# Altium project Custom_PFC.PrjPcb
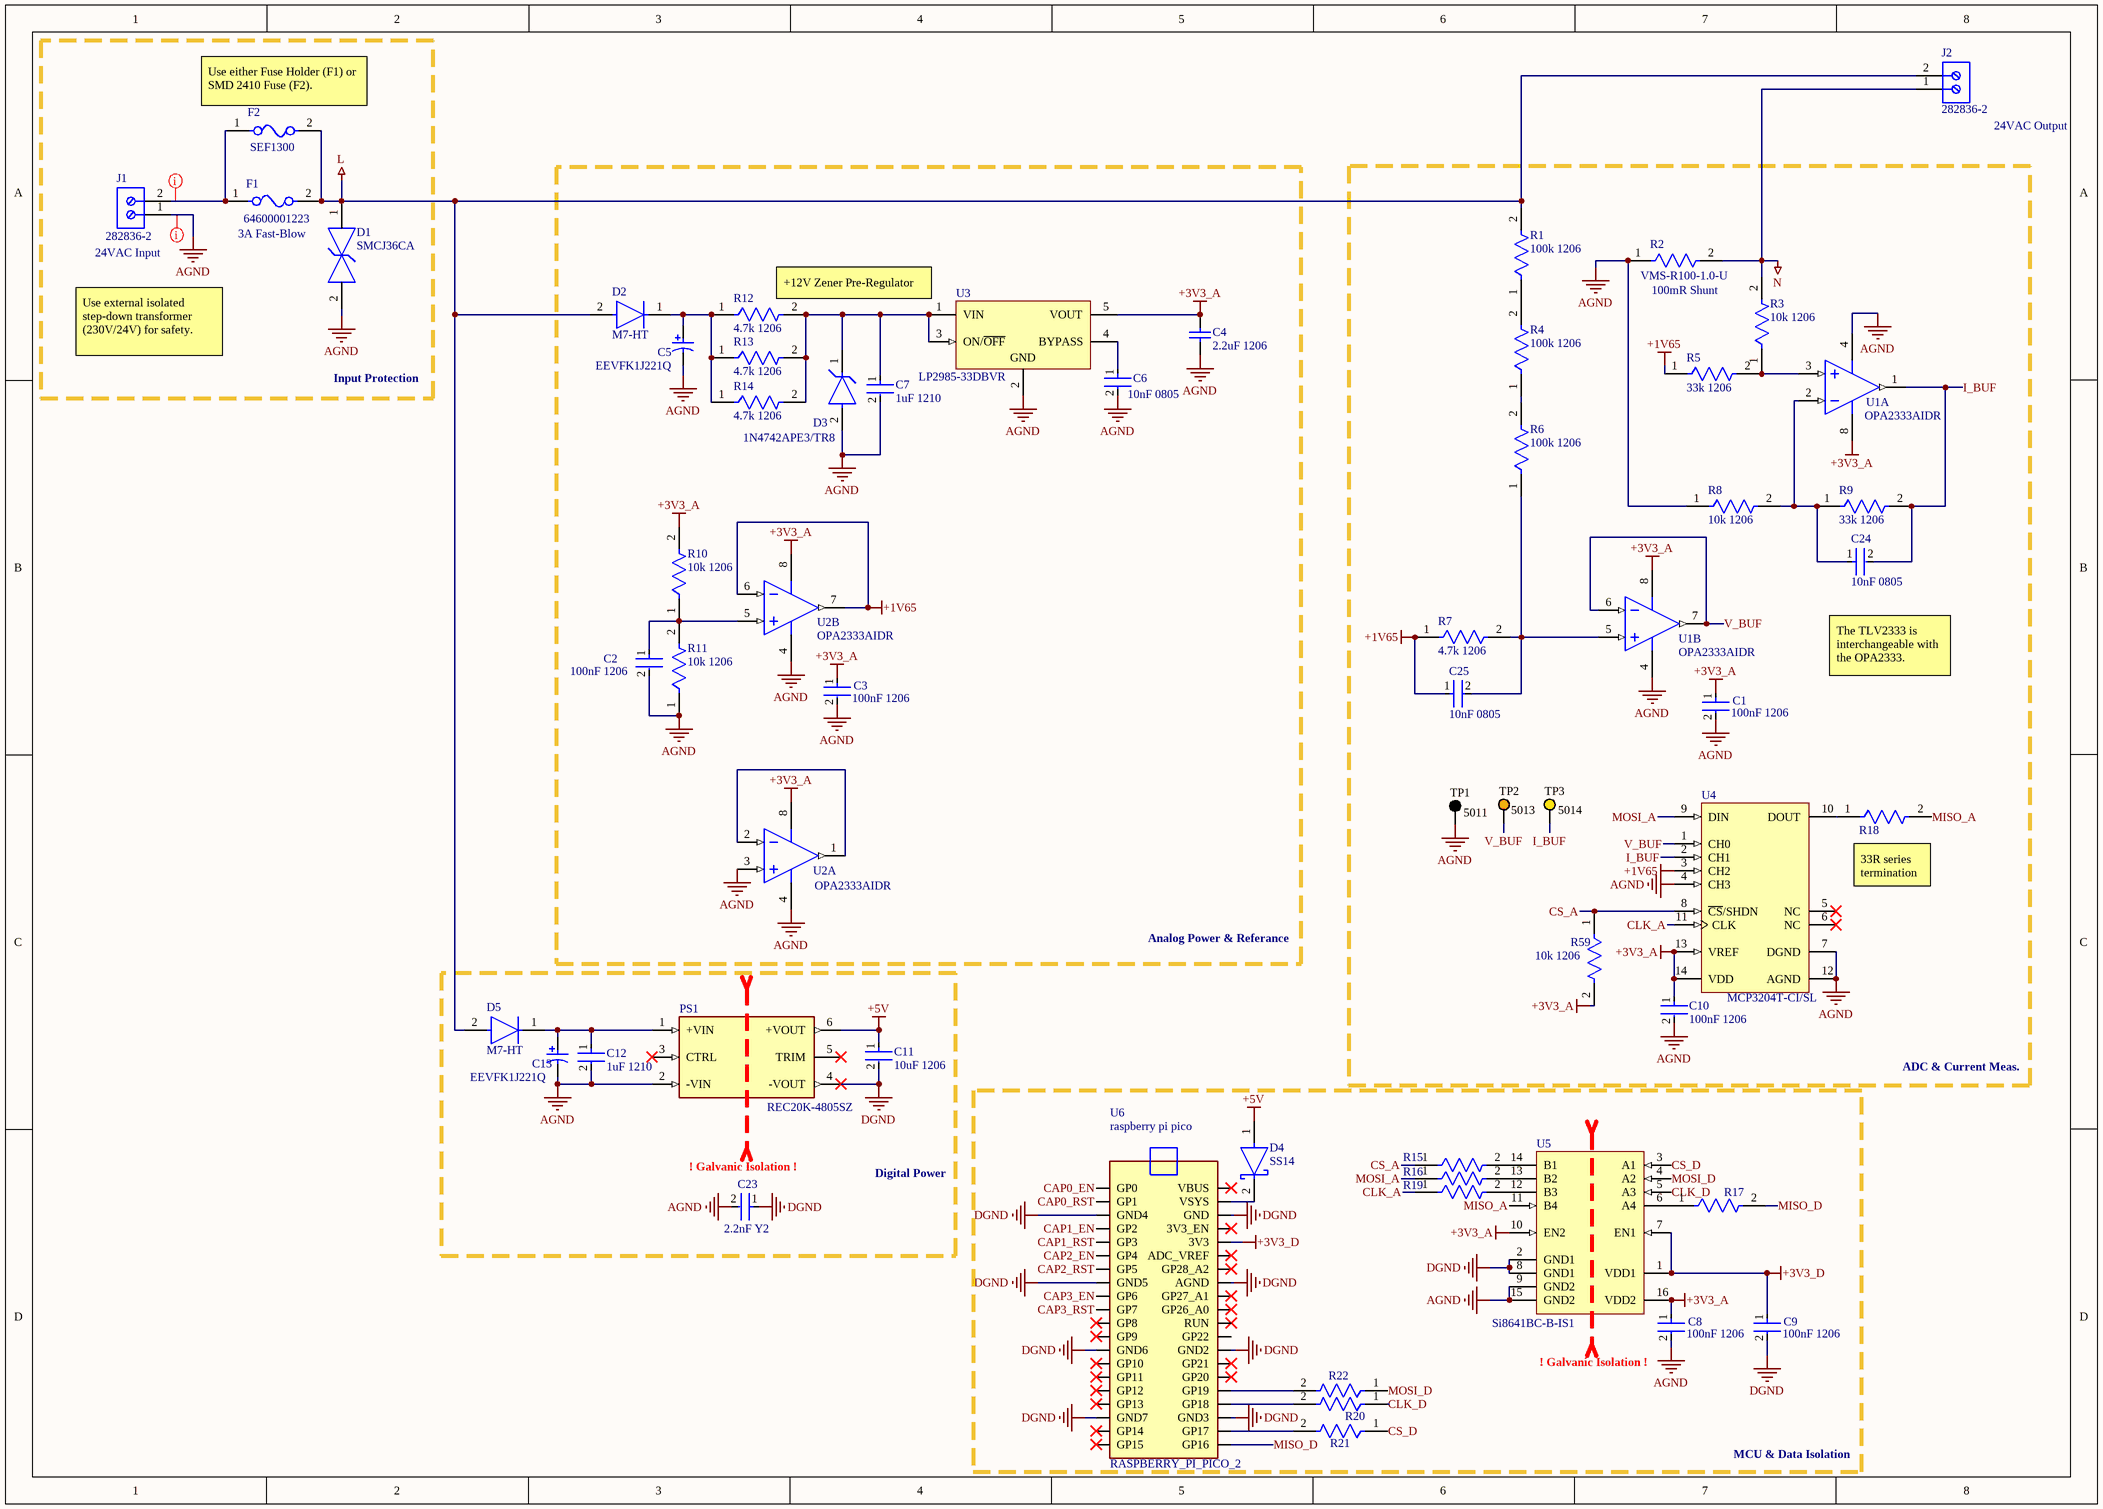
[diagram p0: Measurement_Control.SchDoc]
2 sheets, 127 parts. Net scope: global (net labels, ports and power ports of the same name join across sheets).
Board file: Main.PcbDoc
Sheets:
  Measurement_Control.SchDoc
  Capacitor_Bank.SchDoc

## Sheet Measurement_Control.SchDoc
size A3; DrawnBy: Ebubekir Tasci; SheetNumber: 1; SheetTotal: 2

### Parts
C1  100nF 1206  [FP-C1206X104J3GACTU-MFG]
C2  100nF 1206  [FP-C1206X104J3GACTU-MFG]
C3  100nF 1206  [FP-C1206X104J3GACTU-MFG]
C4  2.2uF 1206  [CAPC1206(3216)190_M]
C5  EEVFK1J221Q  [PNSC-FK-V-H13_V]
C6  10nF 0805  [FP-C0805C-DN-MFG]
C7  1uF 1210  [FP-CL32-IPC_C]
C8  100nF 1206  [FP-C1206X104J3GACTU-MFG]
C9  100nF 1206  [FP-C1206X104J3GACTU-MFG]
C10  100nF 1206  [FP-C1206X104J3GACTU-MFG]
C11  10uF 1206  [FP-C1206C-EH-MFG]
C12  1uF 1210  [FP-CL32-IPC_C]
C13  EEVFK1J221Q  [PNSC-FK-V-H13_V]
C23  2.2nF Y2  [FP-DE2_D8_T5_F5_d0_6-0_05-MFG]
C24  10nF 0805  [FP-C0805C-DN-MFG]
C25  10nF 0805  [FP-C0805C-DN-MFG]
D1  SMCJ36CA  [FP-SMCJ-MFG]
D2  M7-HT  [FP-SMA-MFG]
D3  1N4742APE3/TR8  [FP-1N4742APE3-TR8-MFG]
D4  SS14  [FP-403AE-MFG]
D5  M7-HT  [FP-SMA-MFG]
F1  64600001223  [FP-64600001223-MFG]
F2  SEF1300  [FP-0451-MFG]
J1  282836-2  [TECO-282836-2_V]
J2  282836-2  [TECO-282836-2_V]
PS1  REC20K-4805SZ  [CONV_REC20K-4805SZ]
R1  100k 1206  [FP-RQ732B-IPC_C]
R2  VMS-R100-1.0-U  [FP-CRA2512-IPC_C]
R3  10k 1206  [FP-RT1206-MFG]
R4  100k 1206  [FP-RQ732B-IPC_C]
R5  33k 1206  [FP-RT1206-MFG]
R6  100k 1206  [FP-RQ732B-IPC_C]
R7  4.7k 1206  [FP-AT1206-IPC_B]
R8  10k 1206  [FP-RT1206-MFG]
R9  33k 1206  [FP-RT1206-MFG]
R10  10k 1206  [FP-RT1206-MFG]
R11  10k 1206  [FP-RT1206-MFG]
R12  4.7k 1206  [FP-AT1206-IPC_B]
R13  4.7k 1206  [FP-AT1206-IPC_B]
R14  4.7k 1206  [FP-AT1206-IPC_B]
R15  33R 0805  [FP-RT0805-MFG]  (value not drawn)
R16  33R 0805  [FP-RT0805-MFG]  (value not drawn)
R17  33R 0805  [FP-RT0805-MFG]  (value not drawn)
R18  33R 0805  [FP-RT0805-MFG]  (value not drawn)
R19  33R 0805  [FP-RT0805-MFG]  (value not drawn)
R20  33R 0805  [FP-RT0805-MFG]  (value not drawn)
R21  33R 0805  [FP-RT0805-MFG]  (value not drawn)
R22  33R 0805  [FP-RT0805-MFG]  (value not drawn)
R59  10k 1206  [FP-RT1206-MFG]
TP1  5011  [KSTN-5011_V]
TP2  5013  [KSTN-5013_V]
TP3  5014  [KSTN-5014_V]
U1  OPA2333AIDR  [D0008A_N]  (parts A,B of 2)
U2  OPA2333AIDR  [D0008A_N]  (parts A,B of 2)
U3  LP2985-33DBVR  [DBV0005A_M]
U4  MCP3204T-CI/SL  [SOIC-SL14_N]
U5  Si8641BC-B-IS1  [SLAB-SOIC-16-NB_M]
U6  RASPBERRY_PI_PICO_2  [RASPBERRY_PI_PICO]

### Blocks framed on the sheet
Analog Power & Referance: C2-C7 D2 D3 R10-R14 U2 U3

### Nets
+1V65: C25.1 R5.1 R7.1 U2.6(IN_B-) U2.7(OUT_B) U4.3(CH2)
+3V3_A: C1.1 C3.1 C4.2 C8.1 C10.1 R10.2 R59.2 U1.8(V+) U2.8(V+) U3.5(VOUT) U4.13(VREF) U4.14(VDD) U5.10(EN2) U5.16(VDD2)
+3V3_D: C9.1 U5.1(VDD1) U5.7(EN1) U6.3V3
+5V: C11.1 D4.1(A) PS1.6(+VOUT)
AGND: C1.2 C2.2 C3.2 C4.1 C5.2 C6.2 C7.2 C8.2 C10.2 C12.2 C13.2 C23.2 D1.2 D3.2(A) J1.1 PS1.2(-VIN) R2.1 R8.1 R11.1 TP1.1 U1.4(V-) U2.3(IN_A+) U2.4(V-) U3.2(GND) U4.4(CH3) U4.7(DGND) U4.12(AGND) U5.9(GND2) U5.15(GND2)
DGND: C9.2 C11.2 C23.1 PS1.4(-VOUT) U5.2(GND1) U5.8(GND1) U6.AGND U6.GND U6.GND2 U6.GND3 U6.GND4 U6.GND5 U6.GND6 U6.GND7
L: D1.1 D2.2(A) D5.2(A) F1.2 F2.2 J2.2 R1.2
N: J2.1 R2.2 R3.2
CAP0_EN: U6.GP0
CAP0_RST: U6.GP1
CAP1_EN: U6.GP2
CAP1_RST: U6.GP3
CAP2_EN: U6.GP4
CAP2_RST: U6.GP5
CAP3_EN: U6.GP6
CAP3_RST: U6.GP7
CLK_A: R19.1 U4.11(CLK)
CLK_D: R20.1 U5.5(A3)
CS_A: R15.1 R59.1 U4.8(~{CS}/SHDN)
CS_D: R21.1 U5.3(A1)
I_BUF: C24.2 R9.2 TP3.1 U1.1(OUT_A) U4.2(CH1)
MISO_A: R18.2 U5.11(B4)
MISO_D: R17.2 U6.GP16
MOSI_A: R16.1 U4.9(DIN)
MOSI_D: R22.1 U5.4(A2)
V_BUF: TP2.1 U1.6(IN_B-) U1.7(OUT_B) U4.1(CH0)
NetC2_1: C2.1 R10.1 R11.2 U2.5(IN_B+)
NetC5_1: C5.1 D2.1(C) R12.1 R13.1 R14.1
NetC6_1: C6.1 U3.4(BYPASS)
NetC7_1: C7.1 D3.1(C) R12.2 R13.2 R14.2 U3.1(VIN) U3.3(ON/~{OFF})
NetC12_1: C12.1 C13.1 D5.1(C) PS1.1(+VIN)
NetC24_1: C24.1 R8.2 R9.1 U1.2(IN_A-)
NetC25_2: C25.2 R6.1 R7.2 U1.5(IN_B+)
NetD4_2: D4.2(C) U6.VSYS
NetF1_1: F1.1 F2.1 J1.2
NetR1_1: R1.1 R4.2
NetR3_1: R3.1 R5.2 U1.3(IN_A+)
NetR4_1: R4.1 R6.2
NetR15_2: R15.2 U5.14(B1)
NetR16_2: R16.2 U5.13(B2)
NetR17_1: R17.1 U5.6(A4)
NetR18_1: R18.1 U4.10(DOUT)
NetR19_2: R19.2 U5.12(B3)
NetR20_2: R20.2 U6.GP18
NetR21_2: R21.2 U6.GP17
NetR22_2: R22.2 U6.GP19
NetU2_1: U2.1(OUT_A) U2.2(IN_A-)

Not connected (* = marked no-connect by the designer): PS1 3(CTRL)* 5(TRIM)*; U4 5(NC)* 6(NC)*; U6 3V3_EN* ADC_VREF* GP8* GP9* GP10* GP11* GP12* GP13* GP14* GP15* GP20* GP21* GP22 GP26_A0* GP27_A1* GP28_A2* RUN* VBUS*

### Layout directives
rule Supply Nets [Voltage = 230.0]; rule Signal Stimulus [Kind - Single Pulse    Level - High    Start Time = 0.000    Stop Time = 10.00m    Period Time = 20.00m]: NetF1_1
rule Supply Nets [Voltage = 0.000]; rule Signal Stimulus [Kind - Single Pulse    Level - High    Start Time = 0.000    Stop Time = 10.00m    Period Time = 20.00m]: AGND

### Notes on the sheet
- (near F2) Use either Fuse Holder (F1) or SMD 2410 Fuse (F2).
- (near J2) 24VAC Output
- 3A Fast-Blow
- (near J1) 24VAC Input
- (near R12) +12V Zener Pre-Regulator
- (near R2) 100mR Shunt
- Use external isolated step-down transformer (230V/24V) for safety.
- Input Protection
- The TLV2333 is interchangeable with the OPA2333.
- 33R series termination
- ADC & Current Meas.
- (near C23) ! Galvanic Isolation !
- Digital Power
- (near C8) ! Galvanic Isolation !
- MCU & Data Isolation
- (in symbol CMP-007-000000-1) raspberry pi pico

### Library data of the parts
C1-C3 C8-C10 = CMP-03020-034648-1: CAP CER 0.1UF 25V C0G/NP0 1206 C1206X104J3GACTU; RoHS Compliant: Yes
C4 = CMP-1037-04830-1: CAP 2.2uF 50V ±5% 1206 (3216 Metric) Thickness 1.9mm SMD; Case-EIA: 1206; Tolerance: Â±5%; Case-Metric: 3216; Value: 2.2uF; Rated Voltage: 50 V; Max Thickness: 1.9 mm; Technology: SMT
C5 C13 = CMP-2000-06222-1: Aluminum Electrolytic Capacitor, 220 uF, +/- 20%, 63 V, 2-Pin SMD (Size Code H13), -55 to 105 degC, RoHS, Tape and Reel; Manufacturer: Panasonic; Impedance: 0.16ohm; Life Time @ Temperature: 2000hours@105°C; Product Range: PANASONIC-?????FK; Voltage Rating: 63V; External Length / Height: 13.5mm; Ripple Current Temperature: 105°C; Ripple Current Frequency: 100kHz; Ripple Current AC: 800mA; Power Factor: 0.08; Power Factor Frequency: 120Hz; AE Capacitor Case: RadialCan-SMD; Capacitance: 220µF; Operating Lifetime: 2000h; SVHC: NoSVHC(16-Dec-2013); Diameter: 12.5mm; Package Description: 2-Pin Electrolytic Aluminum Capacitor, Body 13.5 x 13.5 mm; Height: 13.5mm; Package URL: http://industrial.panasonic.com/cdbs/www-data/pdf/RDE0000/DME0000COL48.pdf; Lifetime @ Temperature: 2000hours@105°C; Series: FK; Mounting Technology: SurfaceMount; Datasheet Version: 03/2016; Package / Case: H13; Voltage Rating V DC: 63V; Capacitance Tolerance ±: ±20%; Tolerance +: 20%; Capacitance Tolerance: ±20%; Package Reference: FK-V-H13; Datasheet URL: https://industrial.panasonic.com/cdbs/www-data/pdf/RDE0000/ABA0000C1181.pdf; Operating Temperature Range: -55°Cto+105°C; Manufacturer URL: http://www.panasonic.com/; Operating Temperature Min: -55°C; Capacitor Terminals: SMD; Packaging: CutTape; Operating Temperature Max: 105°C; Tolerance -: 20%; Operating life Time: 2000h; Capacitor Case Style: SMD
C6 C24 C25 = CMP-1036-03849-3: CAP CER 10000PF 100V NP0 0805 C0805C103F1GACTU; Manufacturer: KEMET; Temperature Coefficient: 30ppm/°C; Value: 10,000 pF; Material: Ceramic; Temperature Characteristic: C0G; Tolerance: 0.01; Temperature: -55°C to +125°C; Ipc Land Pattern Name: CAPC200125X78; Octopart: https://octopart.com/c0805c103f1gactu-kemet-18614614; Package: C0805C-DN; Mouser Description: Cap Ceramic 0.01uF 100V C0G 1% Pad SMD 0805 125C T/R; Height: 0.88mm; Category: Cap; ComponentLink2Description: Datasheet; Device Class L2: Capacitors; Lead Free: Yes; Temperature Range Low: -55°C; RoHS: TRUE; Device Class L1: Passive Components; Temperature Range High: +125°C; Automotive: No; Digikey Description: CAP CER 10000PF 100V NP0 0805; Voltage Rating: 100 V; Device Class L3: Ceramic Capacitors; ComponentLink2URL: https://content.kemet.com/datasheets/KEM_C1003_C0G_SMD.pdf; Capacitance: 10,000 pF; Manufacturer Part Number: C0805C103F1GACTU
C7 C12 = CMP-13271-002987-1: Cap Ceramic 1uF 50V X7R ±10% SMD 1210 +125°C Embossed T/R CL32B105KBHNNNE; Voltage: 50V; Package Quantity: 1; Radiation Hardening: No; Case Code (Metric): 3225; Packaging: Tape and Reel; Min Operating Temperature: -55°C; Width: 0.098inch; Dielectric: X7R; Case/Package: 1210; Material: Ceramic; Tolerance: 10%; Max Operating Temperature: 125°C; Voltage Rating: 50V; Mount: Surface Mount; Capacitance: 1uF; Case Code (Imperial): 1210; Depth: 2.5mm; Height: 1.6mm; Thickness: 0.071inch; Length: 3.2mm
C11 = CMP-03020-004605-1: CAP CER 10UF 25V X7R 1206 C1206C106K3RACAUTO; Manufacturer: KEMET; Material: Ceramic; Automotive Grade: Grade 1; Temperature Coefficient: 15%; Tolerance: 10%; Manufacturer Part Number: C1206C106K3RACAUTO; Digikey Description: CAP CER 10UF 25V X7R 1206; Lead Free: Yes; Temperature Characteristic: X7R; Temperature: -55°C to +125°C; Temperature Range Low: -55°C; Octopart: https://octopart.com/c1206c106k3racauto-kemet-65707106; Temperature Range High: +125°C; RoHS: TRUE; Package: C1206C-EH; Device Class L1: Passive Components; Device Class L3: Ceramic Capacitors; Automotive: Yes; Value: 10uF; Category: Cap; ComponentLink2Description: Datasheet; Capacitance: 10uF; Height: 1.8mm; ComponentLink2URL: https://content.kemet.com/datasheets/KEM_C1023_X7R_AUTO_SMD.pdf; Voltage Rating: 25V; Device Class L2: Capacitors; Ipc Land Pattern Name: CAPC320160X160
C23 = CMP-06035-063093-1: CAP CER 2200PF 250VAC RADIAL DE2E3KY222MN2AM01F; Lead/Base Style: Formed Leads; Tolerance: 20%; Ratings: X1; Height - Seated (Max): 0.433inch; Package Quantity: 1000; Max Operating Temperature: 125°C; Capacitance: 2.2nF; Packaging: Tape and Reel; Min Operating Temperature: -40°C; Lead Pitch: 0.197inch; Series: KY; Lead Free: Lead Free; RoHS Compliant: Yes; Case/Package: Radial; Mount: Through Hole
D1 = CMP-08607-000079-1: TVS DIODE 36V 58.1V DO214AB; Manufacturer: Littelfuse Inc; Peak Pulse Current: 25.9A; Number Of Channels: 1; Peak Pulse Power: 1500W; Direction: Bidirectional; Breakdown Voltage: 40V; Max Junction Temp: +150°C; Mouser Description: SMCJ Series 58.1 V 1.5 kW Surface Mount Bi-Directional TVS Diode - DO-214AB; Temperature Range Low: -65°C; Package: SMCJ; Device Class L3: unset; Temperature Range High: +150°C; Automotive: No; Octopart: https://octopart.com/smcj36ca-littelfuse-351690; Device Class L2: TVS Diodes; ComponentLink2URL: https://www.littelfuse.com/~/media/electronics/datasheets/tvs_diodes/littelfuse_tvs_diode_smcj_datasheet.pdf.pdf; Category: Diode; RoHS: TRUE; Device Class L1: Circuit Protection; Reverse Standoff Voltage: 36V; Clamping Voltage: 58.1V; Manufacturer Part Number: SMCJ36CA; ComponentLink2Description: Datasheet; Height: 2.62mm; Lead Free: Yes; Temperature: -65°C to +150°C; Digikey Description: TVS DIODE 36V 58.1V DO214AB
D2 D5 = CMP-02540-000086-1: DIODE GEN PURP 1KV 1A DO214AC; Forward Voltage: 1.1V; Reverse Recovery Time: 1.8us; Peak Non-Repetitive Surge Current: 30A; Max Operating Temperature: 150°C; RoHS Compliant: Yes; Series: -; Number of Pins: 2; Packaging: Tape and Reel; Case/Package: SMA; Max Reverse Voltage (DC): 1kV; Min Operating Temperature: -55°C; Average Rectified Current: 1A; Mount: Surface Mount
D3 = CMP-06360-000055-1: DIODE ZENER 12V 1W DO204AL
D4 = CMP-2000-04943-2: DIODE SCHOTTKY 40V 1A SMA; Manufacturer: ON Semiconductor; Peak Reverse Current: 0.2mA; Max Junction Temp: +125°C; Standoff Height: 0.05mm; Max Surge Forward Current: 40A; Mouser Description: Schottky Diodes & Rectifiers SMA 40V 1.0A; RoHS: TRUE; Lead Free: Yes; Manufacturer Part Number: SS14; Device Class L3: Schottky Diodes; Category: Diode; Automotive: No; Digikey Description: DIODE SCHOTTKY 40V 1A SMA; ComponentLink2Description: Datasheet; Device Class L2: Diodes; Height: 2.5mm; Temperature Range High: +125°C; ComponentLink2URL: https://www.onsemi.com/pub/Collateral/SS19-D.PDF; Device Class L1: Discrete Semiconductors; Package: 403AE; Octopart: https://octopart.com/ss14-on+semiconductor-29205033; Max Repetitive Reverse Voltage: 40V; Temperature Range Low: -65°C; Forward Current: 1A; Temperature: -65°C to +125°C
F1 = CMP-08604-000020-1: FUSE BLOCK CART 250V 6.3A PCB; Manufacturer: Littelfuse Inc; Number Of Fuses: 1; Conn Orientation: Horizontal; ComponentLink2URL: https://www.littelfuse.com/~/media/electronics/datasheets/fuse_blocks/littelfuse_fuse_block_646_datasheet.pdf.pdf; Manufacturer Part Number: 64600001223; Mouser Description: Fuse Holder Screw Mount Bulk; Voltage Rating Ac: 250V; Voltage Rating Dc: 250V; Category: Fuse; Fuse Current: 6.3A; Octopart: https://octopart.com/64600001223-littelfuse-39645661; Package: 0; Automotive: No; Height: 12mm; Device Class L3: unset; ComponentLink2Description: Datasheet; Digikey Description: FUSE BLOCK CART 250V 6.3A PCB; Device Class L1: Circuit Protection; Lead Free: Yes; Device Class L2: Fuse Holders; RoHS: TRUE
F2 = CMP-08605-000063-1: FUSE 3A 250V 6125 FAST SMD; Fuse Interrupt Ac Current: 50A; Fuse I2T: 1.65A2Sec; RoHS: TRUE; Voltage Rating: 250V; Automotive: No; Mouser Description: Surface Mount Fuses 250V 3A; Package: 0451; Device Class L2: Fuses; Fuse Current: 3A; ComponentLink2Description: Datasheet; Lead Free: Yes; Temperature Range Low: -55°C; Max Fuse Ac Voltage: 250V; Temperature: -55°C to +125°C; Device Class L1: Circuit Protection; Category: Fuse; Height: 2.94mm; Temperature Range High: +125°C; ComponentLink2URL: https://www.littelfuse.com/~/media/electronics/datasheets/fuses/littelfuse_fuse_451_453_datasheet.pdf.pdf; Fuse Blow Speed: Fast; Device Class L3: unset; Fuse Interrupt Dc Current: 50A
J1 J2 = CMP-1684-00017-1: Female Header, Pitch 5 mm, 1 x 2 Position, Height 10 mm, Tail Length 3.5 mm, Rohs, Bulk; Manufacturer: TE Connectivity; Wire Gauge: 16-30AWG; Product Training Modules: Wire-to-BoardEurostyleTerminalBlocks; Clamp Material - Plating: Brass-NickelPlated; Voltage: 300V; Mating Orientation: HorizontalwithBoard; Current: 13.5A; Pitch: 0.197"(5.00mm); Screw Thread: M3; 3D Model: 282836-2.pdf; Other Names: 5ULV-02B / A98076; Dynamic Catalog: BuchananSeries; Number of Levels: 1; Torque - Screw: 0.68Nm(6Lb-In); Featured Product: EurostyleTerminalBlockConnectors; Positions Per Level: 2; Wire Termination: Screw-RisingCageClamp; Datasheet URL: http://www.te.com.cn/commerce/DocumentDelivery/DDEController?Action=showdoc&DocId=Catalog+Section%7F1308389_EUROSTYLE_TERMINAL_BLOCKS%7F0607%7Fpdf%7FEnglish%7FENG_CS_1308389_EUROSTYLE_TERMINAL_BLOCKS_0607.pdf%7F282836-2; Color: Green; Family: TerminalBlocks-WiretoBoard; RoHS Information: 282836-2StatementofCompliance; Standard Package: 300; Contact Material - Plating: Brass-TinPlated; Manufacturer URL: http://www.te.com; Housing Material: Polyamide(PA66),Nylon6/6; Features: Interlocking(Side); Package Description: Female Header, Pitch 5 mm, 1 x 2 Position, Height 10 mm, Tail Length 3.5 mm; Mounting Type: ThroughHole; Package Reference: THD; Packaging: Bulk; Series: Buchanan; Category: Connectors,Interconnects; Screw Material - Plating: Brass-NickelPlated
PS1 = CMP-068-000000-1: MF: Recom Power; Availability: Unavailable; Package: None; Source: REC20K-4805SZ.SchLib; Pin Count: 6; Price: None; Component Type: Standard; Design Item ID: REC20K-4805SZ; Value: *; MP: REC20K-4805SZ
R1 R4 R6 = CMP-03211-010469-1: RQ732B 1206 100KΩ 0.4W 10ppm/°C 0.1% 200V RQ73C2B100KBTDF; Manufacturer: TE; Automotive Grade: Grade 0; Package: RQ732B; Device Class L2: Resistors; Device Class L1: Passive Components; Tolerance: 0.1%; Value: 100KΩ; Automotive: Yes; Lead Free: Yes; ComponentLink2Description: Datasheet; Temperature Range Low: -55°C; Manufacturer Part Number: RQ73C2B100KBTDF; Temperature Range High: +155°C; Temperature: -55°C to +155°C; Composition: Thin Film; Temperature Coefficient: 10ppm/°C; Ipc Land Pattern Name: RESC310160X60; Voltage Rating: 200V; Power Rating: 0.4W; Octopart: https://octopart.com/rq73c2b100kbtdf-te+connectivity-99292337; Device Class L3: Chip SMD Resistors; Resistance: 100KΩ; RoHS: TRUE; Category: Res; Height: 0.75mm; ComponentLink2URL: https://www.te.com/commerce/DocumentDelivery/DDEController?Action=showdoc&DocId=Data+Sheet%7F1773270-2%7FA%7Fpdf%7FEnglish%7FENG_DS_1773270-2_A.pdf%7F9-2176388-1377; Series: RQ73
R2 = CMP-07231-006698-1: RES.SHUNT (6432) 2512 100m Ohms ±1% 3W AEC-Q200 SMT
R3 R8 R10 R11 R59 = CMP-03412-030854-1: RES SMD 10K OHM 0.1% 1/4W 1206 RT1206BRB0710KL; Manufacturer: Yageo; Temperature Coefficient: 10 ppm/°C; Power Rating: 0.25W; Voltage Rating: 200V; Value: 10KΩ; Tolerance: 0.005; Device Class L1: Passive Components; RoHS: TRUE; Ipc Land Pattern Name: RESC310160X55; Series: RT; Composition: Thin Film; Category: Res; Height: 0.65mm; Temperature Range Low: -55°C; Manufacturer Part Number: RT1206BRB0710KL; ComponentLink2URL: http://www.yageo.com/documents/recent/PYu-RT_1-to-0.01_RoHS_L_9.pdf; Footprint Url: http://www.yageo.com/exep/pages/download/literatures/PYu-R_Mount_10.pdf; Automotive: No; Digikey Description: RES SMD 10K OHM 0.1% 1/4W 1206; Lead Free: Yes; Temperature Range High: +155°C; Device Class L2: Resistors; Mouser Description: Thin Film Resistors 1/4W 10K ohm .1% 10ppm; Package: RT1206; Temperature: -55°C to +155°C; ComponentLink2Description: Datasheet; Octopart: https://octopart.com/rt1206brb0710kl-yageo-71402166; Device Class L3: Chip SMD Resistors; Resistance: 10KΩ
R5 R9 = CMP-03412-033789-1: RES SMD 33K OHM 0.25% 1/4W 1206 RT1206CRB0733KL; Manufacturer: Yageo; Value: 33KΩ; Tolerance: 0.01; Voltage Rating: 200V; Temperature Coefficient: 10 ppm/°C; Power Rating: 0.25W; Manufacturer Part Number: RT1206CRB0733KL; Lead Free: Yes; ComponentLink2URL: http://www.yageo.com/documents/recent/PYu-RT_1-to-0.01_RoHS_L_9.pdf; Category: Res; Temperature Range Low: -55°C; RoHS: TRUE; Height: 0.65mm; Device Class L1: Passive Components; Resistance: 33KΩ; Device Class L3: Chip SMD Resistors; Ipc Land Pattern Name: RESC310160X55; Footprint Url: http://www.yageo.com/exep/pages/download/literatures/PYu-R_Mount_10.pdf; Package: RT1206; Octopart: https://octopart.com/rt1206crb0733kl-yageo-71403169; ComponentLink2Description: Datasheet; Temperature Range High: +155°C; Device Class L2: Resistors; Digikey Description: RES SMD 33K OHM 0.25% 1/4W 1206; Series: RT; Composition: Thin Film; Automotive: No; Temperature: -55°C to +155°C
R7 R12-R14 = CMP-03412-045148-1: Thin Film Chip Resistors Automotive Grade 4.7kΩ 0.1% 25ppm/°C 1206 AT1206BRD074K7L
R15-R22 = CMP-03412-000516-1: RES SMD 33 OHM 0.1% 1/8W 0805; Manufacturer Part Number: RT0805BRD0733RL; Manufacturer: Yageo; Tolerance: 0.0025; Value: 33Ω; Power Rating: 0.125W; Voltage Rating: 150V; Temperature Coefficient: 25 ppm/°C; Height: 0.6mm; Automotive: No; Temperature: -55°C to +155°C; Digikey Description: RES SMD 33 OHM 0.1% 1/8W 0805; Temperature Range High: +155°C; RoHS: TRUE; Footprint Url: http://www.yageo.com/exep/pages/download/literatures/PYu-R_Mount_10.pdf; Resistance: 33Ω; Device Class L1: Passive Components; Series: RT; Composition: Thin Film; Ipc Land Pattern Name: RESC200125X50; Category: Res; ComponentLink2Description: Datasheet; Device Class L2: Resistors; Mouser Description: Res Thin Film 0805 33 Ohm 0.1% 1/8W ±25ppm/°C Molded SMD SMD Paper T/R; Device Class L3: Chip SMD Resistors; ComponentLink2URL: http://www.yageo.com/documents/recent/PYu-RT_1-to-0.01_RoHS_L_9.pdf; Package: RT0805; Lead Free: Yes; Octopart: https://octopart.com/rt0805brd0733rl-yageo-1409436; Temperature Range Low: -55°C
TP1 = CMP-1672-00003-4: Test Point, Black, Through Hole, RoHS, Bulk; Manufacturer: Keystone; ComponentLink2URL: http://www.keyelco.com/product-pdf.cfm?p=1320; Colour: Black; Pins: 1; REACH SVHC: No SVHC; ComponentLink1URL: http://www.keyelco.com/; PackageReference: 5011; Contact Plating: Silver; Package Quantity: 100; Packaging: Bulk; RoHSCompliant: true; Height: 8.12 mm; PackageDescription: 1-Pin Through Hole Device, Dia 3.17 mm; Mount: Through Hole; Mounting Technology: Through Hole; DatasheetVersion: Rev. F, 12/2013; ComponentLink1Description: Manufacturer URL; Contact Material: Bronze; ComponentLink2Description: Datasheet
TP2 = CMP-1672-00005-4: Test Point, Orange, Through Hole, RoHS, Bulk; Manufacturer: Keystone; REACH SVHC: No SVHC; ComponentLink2Description: Datasheet; PackageDescription: 1-Pin Through Hole Device, Dia 3.17 mm; Package Quantity: 100; PackageReference: 5013; Contact Material: Bronze; DatasheetVersion: Rev. F, 12/2013; ComponentLink2URL: http://www.keyelco.com/product-pdf.cfm?p=1322; Contact Plating: Silver; ComponentLink1URL: http://www.keyelco.com/; Packaging: Bulk; ComponentLink1Description: Manufacturer URL; Colour: Orange; Height: 8.12 mm; RoHSCompliant: True; Mount: Through Hole; Mounting Technology: Through Hole
TP3 = CMP-1672-00006-4: Test Point, Yellow, Through Hole, RoHS, Bulk; Manufacturer: Keystone; PackageDescription: 1-Pin Through Hole Device, Dia 3.17 mm; REACH SVHC: No SVHC; ComponentLink2Description: Datasheet; ComponentLink2URL: http://www.keyelco.com/product-pdf.cfm?p=1323; Package Quantity: 100; Colour: Yellow; Height: 8.12 mm; RoHSCompliant: true; Contact Material: Bronze; Mount: Through Hole; Contact Plating: Silver; ComponentLink1URL: http://www.keyelco.com/; Packaging: Bulk; Mounting Technology: Through Hole; PackageReference: 5014; ComponentLink1Description: Manufacturer URL; DatasheetVersion: Rev. F, 12/2013
U1 U2 = CMP-0272-00762-3: 17 uA, MicroPower, Precision, Zero Drift CMOS Operational Amplifier, 1.8 to 5.5 V, -40 to 125 degC, 8-pin SOIC (D8), Green (RoHS & no Sb/Br); Manufacturer: Texas Instruments; Iq per channel(Max)(mA): 0.025; IIB(Max)(pA): 200; Total Supply Voltage(Min)(+5V is 5, +/-5V is 10): 1.8; Sub Family: Low Offset Voltage Amplifier (<=500uV), Low Power Amp (<=500uA), Low Supply Voltage Amplifier (<=2.7V), Precision Amplifier, Zero Drift Precision Amplifier; Vio (25C)(Max)(mV): 0.01; Offset Drift(Typ)(uV/C): 0.02; Slew Rate(Typ)(V/us): 0.16; Total Supply Voltage(Max)(+5V is 5, +/-5V is 10): 5.5; Number of Channels: 2; CMRR(Min)(dB): 106; ComponentLink1URL: http://www.ti.com/; ComponentLink3URL: http://www.ti.com/litv/pdf/msoi002j; PackageDescription: 8-Pin Plastic Small Outline, Body 4.9 x 3.9 mm, Pitch 1.27 mm; PartNumber: OPA2333AIDR; PackageReference: D0008A; Code_JEDEC: MS-012; Eco-Plan: Green (RoHS & no Sb/Br); ComponentLink2URL: http://www.ti.com/general/docs/lit/getliterature.tsp?genericPartNumber=OPA2333&fileType=pdf; ComponentLink2Description: Datasheet; PackageVersion: 4040047-3/M, 06/2011; ComponentLink1Description: Manufacturer URL; Mounting Technology: Surface Mount; DatasheetVersion: SBOS351C; ComponentLink3Description: Package Specification
U3 = CMP-0758-00080-2: Single Output Low Noise LDO, 150 mA, Fixed 3.3 V Output, 1.5% Tolerance, 2.2 to 16 V Input, Low IQ, 5-Pin SOT-23 (DBV), -40 to 125 degC, Green (RoHS & no Sb/Br), Tape and Reel; Manufacturer: Texas Instruments; Vdo (Typ) (mV): 280; Accuracy (%): 1.5; Output Options: Fixed Output; Fixed Output Options (V): 3.3; Iout (Max) (A): 0.15; Iq (Typ) (mA): 0.85; ComponentLink3Description: Package Specification; Packing: Tape and Reel; ComponentLink3URL: http://www.ti.com/litv/pdf/mpds018j; Vin (V): 2.2 to 16; Mounting Technology: Surface Mount; ComponentLink1URL: http://www.ti.com/; PartNumber: LP2985-33DBVR; PackageReference: DBV0005A; ComponentLink2URL: http://www.ti.com/lit/ds/symlink/lp2985-50.pdf; RoHS: TRUE; ComponentLink2Description: Datasheet; PackageVersion: 4073253-4/L; Operating Temperature Range (degC): -40 to 125; DatasheetVersion: SLVS522N; ComponentLink1Description: Manufacturer URL; PackageDescription: 5-Pin Plastic Small Outline, Body 2.9 x 1.6 mm, Pitch 0.95 mm
U4 = CMP-0188-00363-2: 2.7V 4-Channel/8-Channel 12-Bit A/D Converters with SPI Serial Interface, 14-Pin SOIC 150mil, C Performance Grade, Industrial Temperature, Tape and Reel; ComponentLink2Description: Datasheet; Code_IPC: SOIC127P600-14; DatasheetVersion: revE, Sep-2008; PackageReference: SOIC-SL14; ComponentLink3URL: http://www.microchip.com/stellent/groups/techpub_sg/documents/packagingspec/en012702.pdf; ComponentLink2URL: http://ww1.microchip.com/downloads/en/DeviceDoc/21298e.pdf; RevisionNote: URLs added.; PackageVersion: revBB, Aug-2009; ComponentLink3Description: Package Specification; ComponentLink1URL: http://www.microchip.com/; Code_JEDEC: MS-012-AB; ComponentLink1Description: Manufacturer URL; PackageDescription: 14-Lead Plastic Small Outline (SL) - Narrow, 3.90mm Body [SOIC]
U5 = CMP-0512-00190-1: Low-Power Quad-Channel Digital Isolator, 150 Mbps, 3.75 kVRMS Isolation Rating, -40 to 125 degC, 16-pin SOIC; Manufacturer: Silicon Labs; Maximum Data Rate (Mbps): 150; Maximum Propagation Delay (ns): 13; Sub-Family: Isolators; Enable Control: TRUE; Isolation Rating (kV): 3.75; Channel Type: Unidirectional; 10kV surge: FALSE; Code_IPC: J-STD-020; ComponentLink1URL: http://www.silabs.com/; ComponentLink1Description: Manufacturer URL; DatasheetVersion: Rev. 1.5; Code_JEDEC: MS-012; ComponentLink2Description: Datasheet; PackageDescription: 16-Pin Small-Outline Integrated Circuit, Body 9.9 x 3.9 mm, Pitch 1.27 mm; ComponentLink3URL: http://www.silabs.com/Support%20Documents/TechnicalDocs/si2401.pdf; ComponentLink2URL: http://www.silabs.com/Support%20Documents/TechnicalDocs/Si864x.pdf; PackageReference: SOIC-16-NB; PartNumber: Si8641BC-B-IS1; ComponentLink3Description: Package Specification; Mounting Technology: Surface Mount; AEC-Q100: FALSE
U6 = CMP-007-000000-1: Raspberry Pi Board, Arm Cortex-M0+; Core Architecture:Arm; Core Sub-Architecture:Cortex-M0+; Kit Contents:Raspberry Pi Pico Board; No. Of Bits:32Bit; Silicon Core Number:Rp2040; Silicon Manufacturer:Raspberry Pi; Package: None; Component Type: Standard; Value: *; MF: Raspberry Pi; Pin Count: 40; Check_prices: https://www.snapeda.com/parts/RASPBERRY%20PI%20PICO/Raspberry+Pi/view-part/?ref=eda; Source: RASPBERRY_PI_PICO.SchLib; Design Item ID: RASPBERRY_PI_PICO; SnapEDA_Link: https://www.snapeda.com/parts/RASPBERRY%20PI%20PICO/Raspberry+Pi/view-part/?ref=snap; MP: RASPBERRY PI PICO

## Sheet Capacitor_Bank.SchDoc
size A3; SheetNumber: 2; SheetTotal: 2
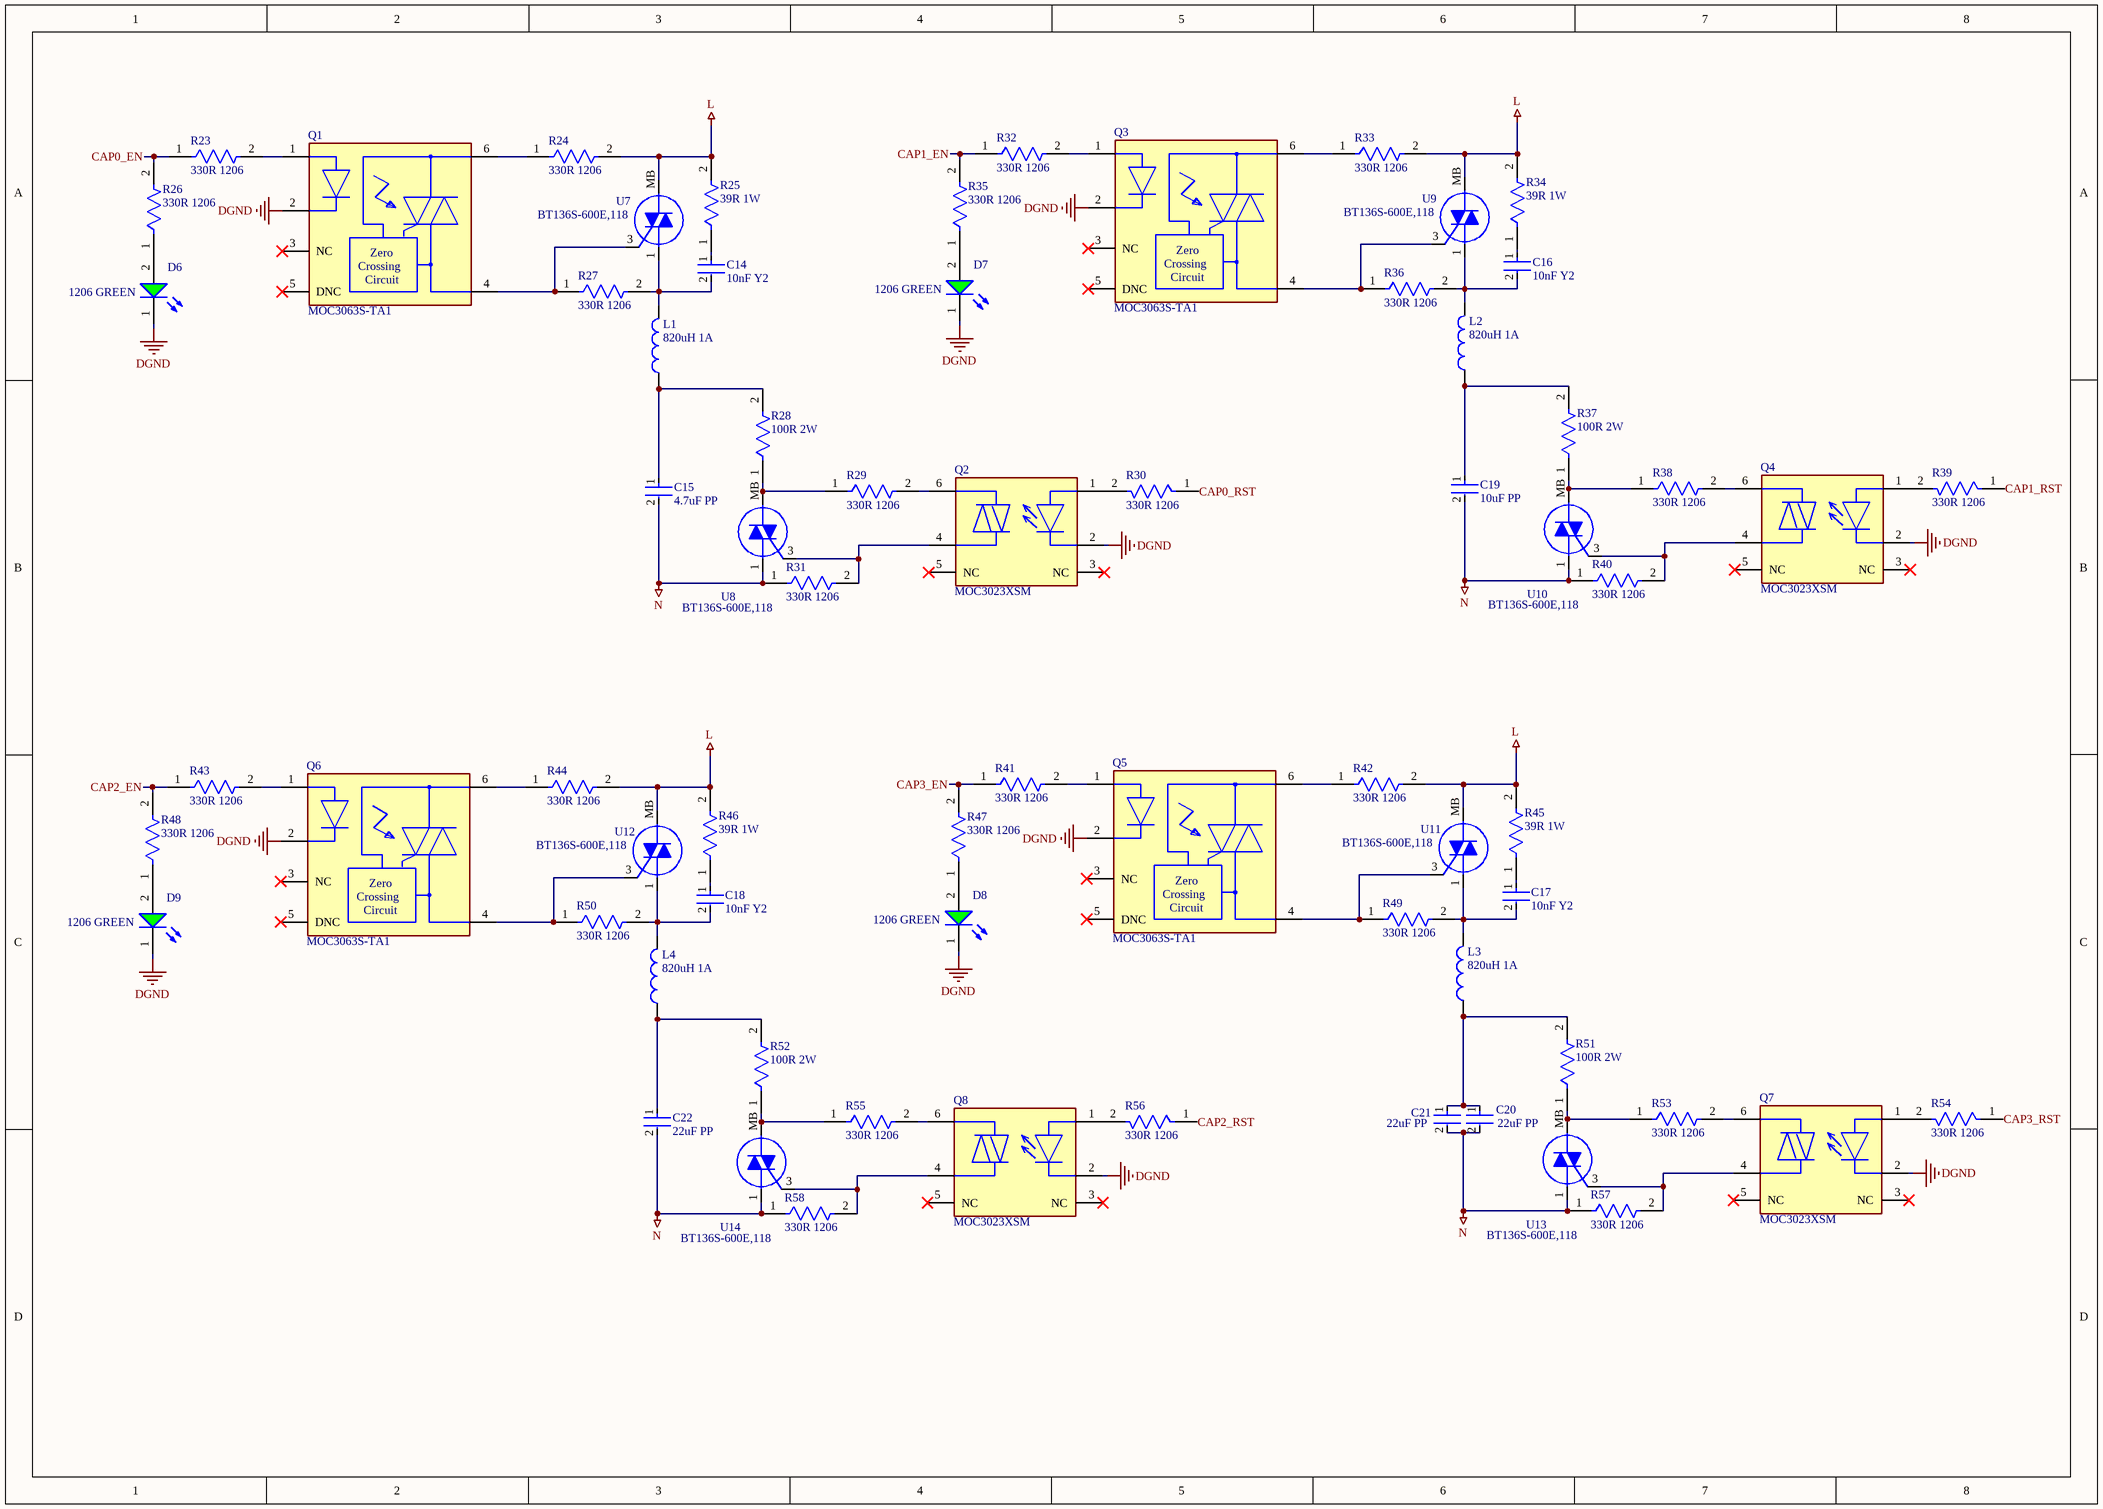
[diagram p1: Capacitor_Bank.SchDoc]

### Parts
C14  10nF Y2  [FP-R46KF310040P1M-MFG]
C15  4.7uF PP  [FP-C4BUY-MFG]
C16  10nF Y2  [FP-R46KF310040P1M-MFG]
C17  10nF Y2  [FP-R46KF310040P1M-MFG]
C18  10nF Y2  [FP-R46KF310040P1M-MFG]
C19  10uF PP  [FP-F17725102000-MFG]
C20  22uF PP  [FP-F17725102000-MFG]
C21  22uF PP  [FP-F17725102000-MFG]
C22  22uF PP  [FP-F17725102000-MFG]
D6  1206 GREEN  [WL-SMCW_1206_150120xx75000]
D7  1206 GREEN  [WL-SMCW_1206_150120xx75000]
D8  1206 GREEN  [WL-SMCW_1206_150120xx75000]
D9  1206 GREEN  [WL-SMCW_1206_150120xx75000]
L1  820uH 1A  [INDR62-500-1100X850X1100]
L2  820uH 1A  [INDR62-500-1100X850X1100]
L3  820uH 1A  [INDR62-500-1100X850X1100]
L4  820uH 1A  [INDR62-500-1100X850X1100]
Q1  MOC3063S-TA1  [FP-646BY-MFG]
Q2  MOC3023XSM  [FP-646BY-MFG]
Q3  MOC3063S-TA1  [FP-646BY-MFG]
Q4  MOC3023XSM  [FP-646BY-MFG]
Q5  MOC3063S-TA1  [FP-646BY-MFG]
Q6  MOC3063S-TA1  [FP-646BY-MFG]
Q7  MOC3023XSM  [FP-646BY-MFG]
Q8  MOC3023XSM  [FP-646BY-MFG]
R23  330R 1206  [FP-RMCF1206-IPC_A]
R24  330R 1206  [FP-RMCF1206-IPC_A]
R25  39R 1W  [FP-G001R1000FE1280-MFG]
R26  330R 1206  [FP-RMCF1206-IPC_A]
R27  330R 1206  [FP-RMCF1206-IPC_A]
R28  100R 2W  [FP-PR02000201003JA100-MFG]
R29  330R 1206  [FP-RMCF1206-IPC_A]
R30  330R 1206  [FP-RMCF1206-IPC_A]
R31  330R 1206  [FP-RMCF1206-IPC_A]
R32  330R 1206  [FP-RMCF1206-IPC_A]
R33  330R 1206  [FP-RMCF1206-IPC_A]
R34  39R 1W  [FP-G001R1000FE1280-MFG]
R35  330R 1206  [FP-RMCF1206-IPC_A]
R36  330R 1206  [FP-RMCF1206-IPC_A]
R37  100R 2W  [FP-PR02000201003JA100-MFG]
R38  330R 1206  [FP-RMCF1206-IPC_A]
R39  330R 1206  [FP-RMCF1206-IPC_A]
R40  330R 1206  [FP-RMCF1206-IPC_A]
R41  330R 1206  [FP-RMCF1206-IPC_A]
R42  330R 1206  [FP-RMCF1206-IPC_A]
R43  330R 1206  [FP-RMCF1206-IPC_A]
R44  330R 1206  [FP-RMCF1206-IPC_A]
R45  39R 1W  [FP-G001R1000FE1280-MFG]
R46  39R 1W  [FP-G001R1000FE1280-MFG]
R47  330R 1206  [FP-RMCF1206-IPC_A]
R48  330R 1206  [FP-RMCF1206-IPC_A]
R49  330R 1206  [FP-RMCF1206-IPC_A]
R50  330R 1206  [FP-RMCF1206-IPC_A]
R51  100R 2W  [FP-PR02000201003JA100-MFG]
R52  100R 2W  [FP-PR02000201003JA100-MFG]
R53  330R 1206  [FP-RMCF1206-IPC_A]
R54  330R 1206  [FP-RMCF1206-IPC_A]
R55  330R 1206  [FP-RMCF1206-IPC_A]
R56  330R 1206  [FP-RMCF1206-IPC_A]
R57  330R 1206  [FP-RMCF1206-IPC_A]
R58  330R 1206  [FP-RMCF1206-IPC_A]
U7  BT136S-600E,118  [IC_BT136S-600E,118]
U8  BT136S-600E,118  [IC_BT136S-600E,118]
U9  BT136S-600E,118  [IC_BT136S-600E,118]
U10  BT136S-600E,118  [IC_BT136S-600E,118]
U11  BT136S-600E,118  [IC_BT136S-600E,118]
U12  BT136S-600E,118  [IC_BT136S-600E,118]
U13  BT136S-600E,118  [IC_BT136S-600E,118]
U14  BT136S-600E,118  [IC_BT136S-600E,118]

### Nets
DGND: D6.1(K) D7.1(K) D8.1(K) D9.1(K) Q1.2(C) Q2.2(C) Q3.2(C) Q4.2(C) Q5.2(C) Q6.2(C) Q7.2(C) Q8.2(C)
L: R24.2 R25.2 R33.2 R34.2 R42.2 R44.2 R45.2 R46.2 U7.MB(T2) U9.MB(T2) U11.MB(T2) U12.MB(T2)
N: C15.2 C19.2 C20.2 C21.2 C22.2 R31.1 R40.1 R57.1 R58.1 U8.1(T1) U10.1(T1) U13.1(T1) U14.1(T1)
CAP0_EN: R23.1 R26.2
CAP0_RST: R30.1
CAP1_EN: R32.1 R35.2
CAP1_RST: R39.1
CAP2_EN: R43.1 R48.2
CAP2_RST: R56.1
CAP3_EN: R41.1 R47.2
CAP3_RST: R54.1
NetC14_1: C14.1 R25.1
NetC14_2: C14.2 L1.2 R27.2 U7.1(T1)
NetC15_1: C15.1 L1.1 R28.2
NetC16_1: C16.1 R34.1
NetC16_2: C16.2 L2.2 R36.2 U9.1(T1)
NetC17_1: C17.1 R45.1
NetC17_2: C17.2 L3.2 R49.2 U11.1(T1)
NetC18_1: C18.1 R46.1
NetC18_2: C18.2 L4.2 R50.2 U12.1(T1)
NetC19_1: C19.1 L2.1 R37.2
NetC20_1: C20.1 C21.1 L3.1 R51.2
NetC22_1: C22.1 L4.1 R52.2
NetD6_2: D6.2(A) R26.1
NetD7_2: D7.2(A) R35.1
NetD8_2: D8.2(A) R47.1
NetD9_2: D9.2(A) R48.1
NetQ1_1: Q1.1(A) R23.2
NetQ1_4: Q1.4(1_MAIN_TERM.) R27.1 U7.3(G)
NetQ1_6: Q1.6(2_MAIN_TERM.) R24.1
NetQ2_1: Q2.1(A) R30.2
NetQ2_4: Q2.4(1_MAIN_TERM) R31.2 U8.3(G)
NetQ2_6: Q2.6(2_MAIN_TERM) R29.2
NetQ3_1: Q3.1(A) R32.2
NetQ3_4: Q3.4(1_MAIN_TERM.) R36.1 U9.3(G)
NetQ3_6: Q3.6(2_MAIN_TERM.) R33.1
NetQ4_1: Q4.1(A) R39.2
NetQ4_4: Q4.4(1_MAIN_TERM) R40.2 U10.3(G)
NetQ4_6: Q4.6(2_MAIN_TERM) R38.2
NetQ5_1: Q5.1(A) R41.2
NetQ5_4: Q5.4(1_MAIN_TERM.) R49.1 U11.3(G)
NetQ5_6: Q5.6(2_MAIN_TERM.) R42.1
NetQ6_1: Q6.1(A) R43.2
NetQ6_4: Q6.4(1_MAIN_TERM.) R50.1 U12.3(G)
NetQ6_6: Q6.6(2_MAIN_TERM.) R44.1
NetQ7_1: Q7.1(A) R54.2
NetQ7_4: Q7.4(1_MAIN_TERM) R57.2 U13.3(G)
NetQ7_6: Q7.6(2_MAIN_TERM) R53.2
NetQ8_1: Q8.1(A) R56.2
NetQ8_4: Q8.4(1_MAIN_TERM) R58.2 U14.3(G)
NetQ8_6: Q8.6(2_MAIN_TERM) R55.2
NetR28_1: R28.1 R29.1 U8.MB(T2)
NetR37_1: R37.1 R38.1 U10.MB(T2)
NetR51_1: R51.1 R53.1 U13.MB(T2)
NetR52_1: R52.1 R55.1 U14.MB(T2)

Not connected (* = marked no-connect by the designer): Q1 3(NC)* 5(DNC)*; Q2 3(NC)* 5(NC)*; Q3 3(NC)* 5(DNC)*; Q4 3(NC)* 5(NC)*; Q5 3(NC)* 5(DNC)*; Q6 3(NC)* 5(DNC)*; Q7 3(NC)* 5(NC)*; Q8 3(NC)* 5(NC)*

### Notes on the sheet
- (in symbol CMP-07144-000013-1) Zero; Crossing; Circuit

### Library data of the parts
C14 C16-C18 = CMP-00212-22103502-1: C43Q1103K6SC000 / CAP.FILM 10nF 300VAC ±10% 15mm Radial 13x12x6 Y2 MKP Metallized Polypropylene (PP) THT; Voltage Rating (AC): 275V; Capacitance: 100nF; Tolerance: 20%; Lead Diameter: 600µm; Voltage Rating: 560V; NexarPartId: 22103502; Min Operating Temperature: -40°C; Height - Seated (Max): 12.0904mm; Mount: Through Hole; Dielectric Material: PP; Lead Pitch: 10mm; REACH SVHC: No SVHC; Depth: 5mm; Height: 6mm; RoHS: Compliant; Max Operating Temperature: 110°C; Termination: Radial; Case/Package: Radial; Packaging: Bulk; Voltage Rating (DC): 560V; Width: 5.9944mm; Length: 13mm; Schedule B: 8532250010; Dielectric: PP
C15 = CMP-03022-000053-1: CAP.FILM 4.7uF 305VAC ±10% 27.5mm Radial 32x33x18 X2 MKP Metallized Polypropylene (PP) THT C42Q2475KBAC000
C19 = CMP-02419-000004-1: C3D2K106KB00382 CAP.FILM 10uF 800VDC ±10% 27.5mm Radial 32x37x22 MKP Metallized Polypropylene (PP) THT; Dielectric Material: Polyester; Capacitance: 1uF; Voltage Rating (AC): 275V; Tolerance: 10%; RoHS Compliant: Yes; Number of Pins: 2
C20-C22 = CMP-02419-000004-1: C3D2H226JB00C00 CAP.FILM 22uF 500VDC ±5% 27.5mm Radial 32x37x22 MKP Metallized Polypropylene (PP) THT; Dielectric Material: Polyester; Capacitance: 1uF; Tolerance: 10%; Voltage Rating (AC): 275V; RoHS Compliant: Yes; Number of Pins: 2
D6-D9 = CMP-1426-00014-6: LED Uni-Color Green 515nm 2-Pin Chip 1206(3216Metric) T/R; Manufacturer Lifecycle Status: ACTIVE; Wavelength: 525nm; Max Junction Temperature (Tj): 95°C; Reverse Voltage: 5V; YEOL: 1 = Estimated lifetime > 10 years; Forward Current: 100mA; Luminous Intensity: 450mcd; Power Dissipation: 105mW; Test Current: 20mA; Lens Style: Clear, Rectangular; Viewing Angle: 140°; Forward Voltage: 3.2V; Height: 680µm; Packaging: Tape and Reel; RoHS: Compliant; Mount: Surface Mount; Max Operating Temperature: 85°C; Case/Package: 1206; Color: Green; Max Reverse Voltage (DC): 5V; Case Code (Metric): 3216; Min Operating Temperature: -40°C; Width: 1.6mm; Dominant Wavelength: 525nm; Length: 3.2mm; Lifecycle Status: Production; REACH SVHC: Unknown; Peak Wavelength: 515nm; Case Code (Imperial): 1206
L1-L4 = CMP-1747-00016-1: IND TH 820uH 1000mA ISAT=1000mA %10 F=5/10x15.5; Max Operating Temperature: 70 degC; PackageDescription: 2-Pin Radial Lead, Dia 8.5 mm, Pitch 5 mm; Min Operating Temperature: 0 degC; Mount: Through Hole; PackageReference: INDR62-500-1100X850X1100
Q1 Q3 Q5 Q6 = CMP-07144-000013-1: OPTOISOLATOR 4.17KV TRIAC 6SMD; Manufacturer Part Number: MOC3063SM; Manufacturer: ON Semiconductor; Standoff Height: 0.38mm; Max Junction Temp: +100°C; Power Dissipation: 250mW; Isolation Voltage: 4170Vrms; Reverse Voltage: 6V; Forward Current: 30mA; Forward Voltage: 1.3V; Temperature Range High: +85°C; Footprint Url: https://www.onsemi.com/pub/Collateral/646BY.PDF; Automotive: No; Device Class L2: Optocouplers; Digikey Description: OPTOISOLATOR 4.17KV TRIAC 6SMD; ComponentLink2URL: https://www.onsemi.com/pub/Collateral/MOC3163M-D.pdf; Octopart: https://octopart.com/moc3063sm-on+semiconductor-84330445; ComponentLink2Description: Datasheet; Package: 646BY; Device Class L1: Optoelectronics; Temperature Range Low: -40°C; Lead Free: Yes; RoHS: TRUE; Device Class L3: unset; Mouser Description: Triac & SCR Output Optocouplers 6P OPTO TRIAC; Height: 4.8mm; Category: Trans; Temperature: -40°C to +85°C
Q2 Q4 Q7 Q8 = CMP-00278-84330366-1: MOC3023XSM Triac Driver Output Optocoupler, 6-Pin DIP 400V Random Phase
R23 R24 R26 R27 R29-R33 R35 R36 R38-R44 R47-R50 R53-R58 = CMP-26527-006451-1: 330Ω ±5% 0.25W 1206 Thick Film Chip Resistor AEC-Q200 compliant; Max Power Dissipation: 250mW; Temperature Coefficient: 200ppm/°C; Case/Package: 1206; Height: 0.028inch; Contact Plating: Tin; Series: RMCF; Resistor Type: Thick Film; Military Standard: Not; Packaging: Tape and Reel; Resistance: 330R; Features: Automotive AEC-Q200; Width: 0.063inch; Length: 0.126inch; Tolerance: 5%; Mount: Surface Mount; Max Operating Temperature: 155°C; Radiation Hardening: No; Min Operating Temperature: -55°C; Construction: Rectangular; RoHS Compliant: Yes; Number of Terminations: 2; Depth: 1.6mm
R25 R34 R45 R46 = CMP-02408-000025-1: RES.WIREWOUND 1W-S 39 Ohms ±5% Axial Standard THT; Tolerance: 1%; Temperature Coefficient: 90ppm/°C; Case/Package: Ceramic; Construction: Cylindrical; Resistance: 39R; Diameter: 2.16mm; Series: G; Max Operating Temperature: 250°C; Lead Free: Lead Free; Resistor Type: Wirewound; Contact Plating: Tin; Mount: Through Hole; Radiation Hardening: No; RoHS Compliant: Yes; Termination: Axial; Min Operating Temperature: -65°C; Length: 7.14mm; Military Standard: Not; Packaging: Tape and Reel; Power Rating: 1W
R28 R37 R51 R52 = CMP-00030-42817933-1: RES.WIREWOUND 2W-S 100 Ohms ±5% Axial Standard THT KNP02SJ0101A10; Resistance: 100kΩ; Voltage Rating: 500V; Temperature Coefficient: 250ppm/°C; Case/Package: Conformal; Lead Free: Lead Free; Composition: Metal Film; Schedule B: 8533210090, 8533210090; Tolerance: 5%; RoHS: Compliant; Min Operating Temperature: -55°C; NexarPartId: 42817933; Diameter: 3.9mm; Max Operating Temperature: 155°C; Length: 12mm; Width: 3.9mm; Contact Plating: Tin; REACH SVHC: No SVHC; Operating Supply Voltage: 500V; Termination: Axial; Power Rating: 2W; Military Standard: Not; Radiation Hardening: No; Mount: Through Hole; Voltage Rating (DC): 500V
U7-U14 = CMP-070-000000-1: TRIAC Logic - Sensitive Gate 600 V 4 A Surface Mount DPAK; MF: WeEn Semiconductors; Value: *; Design Item ID: BT136S-600E,118; Source: BT136S-600E,118.SchLib; Check_prices: https://www.snapeda.com/parts/BT136S-600E,118/WeEn+Semiconductors/view-part/?ref=eda; SnapEDA_Link: https://www.snapeda.com/parts/BT136S-600E,118/WeEn+Semiconductors/view-part/?ref=snap; Component Type: Standard; MP: BT136S-600E,118; Package: TO-252-3 WeEn Semiconductors; Pin Count: 3

## Nets that join several sheets
DGND: Measurement_Control (14 pins), Capacitor_Bank (12 pins)
L: Measurement_Control (7 pins), Capacitor_Bank (12 pins)
N: Measurement_Control (J2.1 R2.2 R3.2), Capacitor_Bank (13 pins)
CAP0_EN: Measurement_Control (U6.GP0), Capacitor_Bank (R23.1 R26.2)
CAP0_RST: Measurement_Control (U6.GP1), Capacitor_Bank (R30.1)
CAP1_EN: Measurement_Control (U6.GP2), Capacitor_Bank (R32.1 R35.2)
CAP1_RST: Measurement_Control (U6.GP3), Capacitor_Bank (R39.1)
CAP2_EN: Measurement_Control (U6.GP4), Capacitor_Bank (R43.1 R48.2)
CAP2_RST: Measurement_Control (U6.GP5), Capacitor_Bank (R56.1)
CAP3_EN: Measurement_Control (U6.GP6), Capacitor_Bank (R41.1 R47.2)
CAP3_RST: Measurement_Control (U6.GP7), Capacitor_Bank (R54.1)